# Altium schematic sheet Cover_sheet.SchDoc
size A3; SheetNumber: 1; SheetTotal: 17
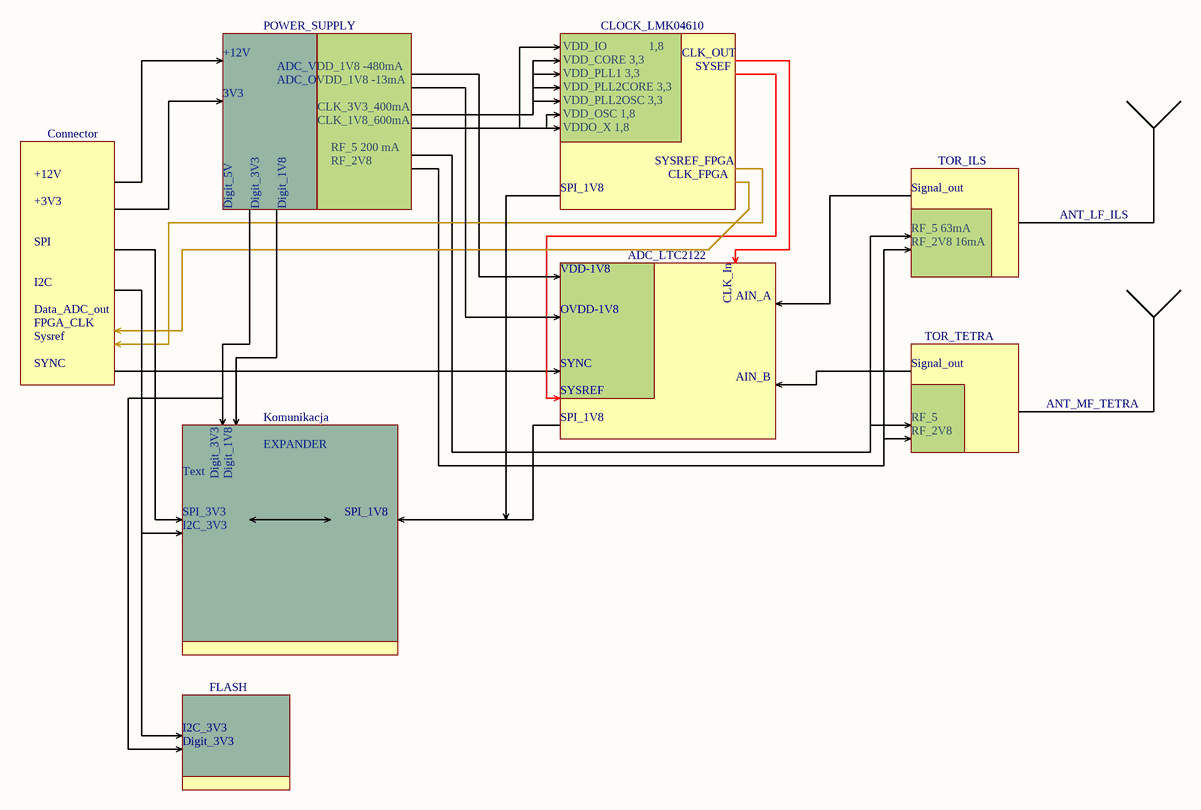
[diagram p0: Cover_sheet.SchDoc]

## Notes on the sheet
- +12V
- POWER_SUPPLY
- ADC_VDD_1V8 -480mA
- VDD_IO             	1,8
- VDD_CORE	3,3
- VDD_PLL1	3,3
- CLOCK_LMK04610
- CLK_OUT
- SYSEF
- Connector
- 3V3
- ADC_OVDD_1V8 -13mA
- CLK_1V8_600mA
- CLK_3V3_400mA
- VDD_PLL2CORE	3,3
- VDD_PLL2OSC	3,3
- VDD_OSC	1,8
- VDDO_X	1,8
- +3V3
- Digit_5V
- Digit_3V3
- Digit_1V8
- RF_5 200 mA
- RF_2V8
- SPI_1V8
- SYSREF_FPGA
- CLK_FPGA
- Signal_out
- TOR_ILS
- SPI
- VDD-1V8
- ADC_LTC2122
- RF_5 63mA
- RF_2V8 16mA
- ANT_LF_ILS
- I2C
- Data_ADC_out
- Sysref
- FPGA_CLK
- OVDD-1V8
- AIN_A
- CLK_In
- TOR_TETRA
- SYNC
- SYSREF
- AIN_B
- ANT_MF_TETRA
- Text
- Komunikacja
- EXPANDER
- RF_5
- SPI_3V3
- I2C_3V3
- FLASH
- Title
- Size:
- Date:
- A3
- Number:
- Time:
- Revision:
- Sheet
- of
- File: